# Altium schematic sheet Transceptor LIN.SchDoc
size A; SheetNumber: 5; SheetTotal: 7
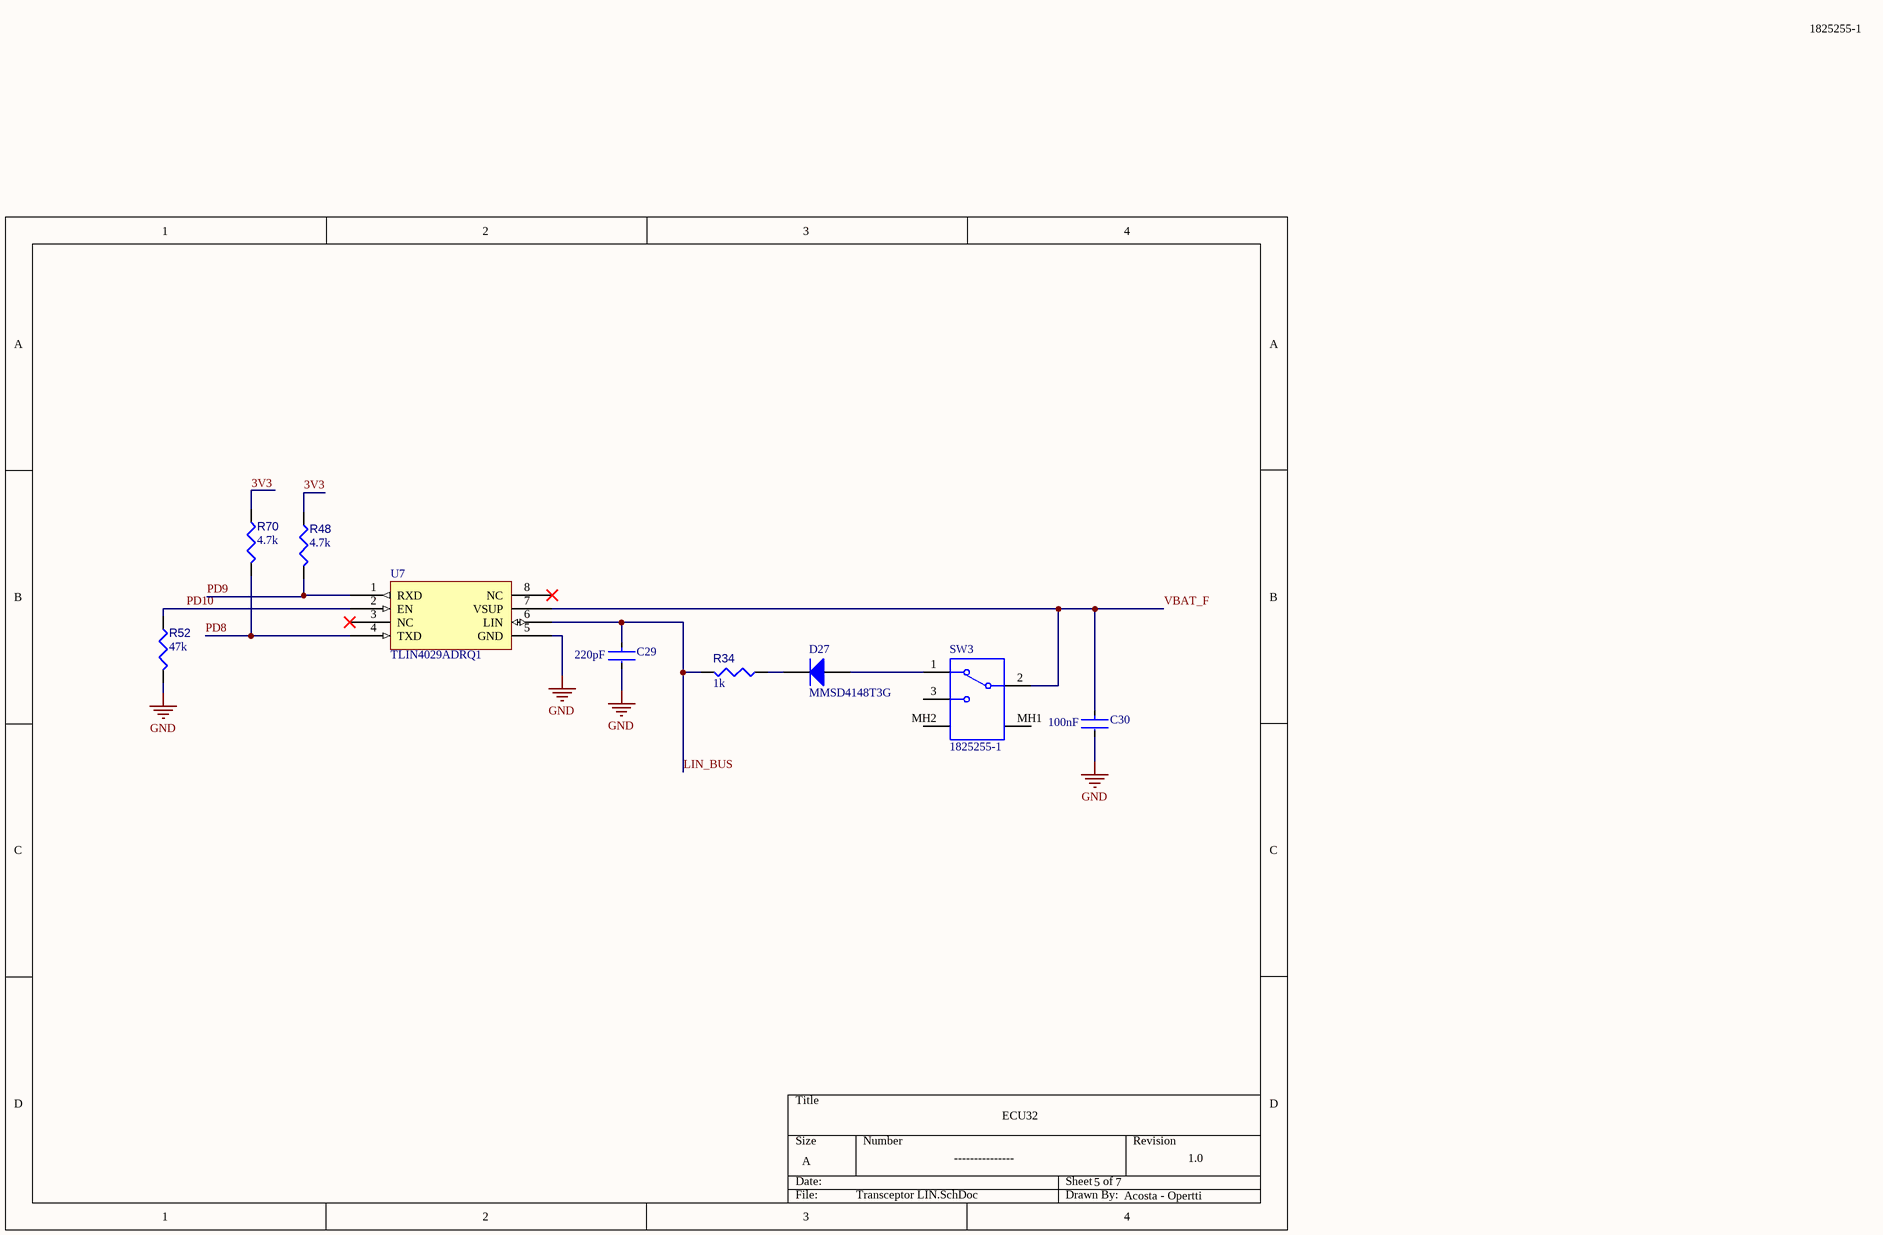
[diagram p0: Transceptor LIN.SchDoc]

## Parts
C29  Capacitance: 220pF  [FP-RCE0DB-MFG]  (hidden comment: C322C221K5R5TA)
C30  Capacitance: 100nF  [FP-RCE0DB-MFG]  (hidden comment: RCE5C1H100J0A2H03B)
D27  MMSD4148T3G  [ONSC-SOD-123-2-425-04_V]
R34  value 1k  [RESA60-630X240]  (hidden comment: MFR-25FBF52-47R5)
R48  value 4.7k  [RESA60-630X240]  (hidden comment: MFR-25FBF52-47R5)
R52  value 47k  [RESA60-630X240]  (hidden comment: MFR-25FBF52-47R5)
R70  value 4.7k  [RESA60-630X240]  (hidden comment: MFR-25FBF52-47R5)
SW3  1825255-1  [TECO-1825255-1_V]
U7  TLIN4029ADRQ1  [SOIC127P600X175-8M]

## Nets
GND: C29.2 C30.2 R52.2 U7.5(GND)
3V3: R48.1 R70.1
LIN_BUS: C29.1 R34.2 U7.6(LIN)
PD8: R70.2 U7.4(TXD)
PD9: R48.2 U7.1(RXD)
PD10: R52.1 U7.2(EN)
VBAT_F: C30.1 SW3.2 U7.7(VSUP)
NetD27_1: D27.1(K) R34.1
NetD27_2: D27.2(A) SW3.1

Not connected (* = marked no-connect by the designer): SW3 3 MH1 MH2; U7 3(NC)* 8(NC)*

## Notes on the sheet
- 1825255-1
- ECU32
- ---------------
- 5
- 7
- 1.0
- Acosta - Opertti

## Library data of the parts
C29 C30 = CMP-06035-046743-1: Cap Ceramic 10pF 50V C0G ±5% Radial 2.5mm +125°C Bulk; Lead Diameter: 0.5mm; Lead/Base Style: Straight; Width: 2.5mm; Voltage Rating: 50V; Max Operating Temperature: 125°C; Length: 0.142inch; Lead Pitch: 0.098inch; Min Operating Temperature: -55°C; Termination: Radial; Tolerance: 5%; Dielectric: C0G; Packaging: Bulk; Package Quantity: 500; Voltage Rating (DC): 50V; Case/Package: Radial; Ratings: AEC-Q200; Lead Free: Lead Free; Height: 3.5mm; Resistor Type: Ceramic; Height - Seated (Max): 0.138inch; Mount: Through Hole
D27 = CMP-0895-00002-2: Switching Diode, 2-Pin SOD-123, Pb-Free, Tape and Reel; Manufacturer: On Semiconductor; Configuration: Single; trr Max (ns): 4; IF Max (A): 0.2; ComponentLink1Description: Manufacturer URL; PackageReference: SOD-123-2-425-04; ComponentLink2Description: Datasheet; PackageVersion: Rev. G, 10/2009; PartNumber: MMSD4148T3G; ComponentLink3Description: Package Specification; ComponentLink1URL: http://www.onsemi.com/; PackageDescription: 2-Pin SOD, Body 1.6 x 2.69 mm; DatasheetVersion: Rev. 11; Packing: Tape and Reel; RoHS: TRUE; ComponentLink2URL: http://www.onsemi.com/pub_link/Collateral/MMSD4148T1-D.PDF; Mounting Technology: Surface Mount; ComponentLink3URL: http://www.onsemi.com/pub_link/Collateral/425-04.PDF
R34 R48 R52 R70 = CMP-009-00058-4: Axial Resistor, 47.5 Ohm, +/- 1%, 0.25 W, -55 to 155 degC, 2-Pin THD, RoHS, Bulk; Manufacturer: Yageo; Voltage Rating: 250V; Power: 250mW; Packaging: Bulk; Package Description: 2-Pin Axial Lead, Dia 2.4 mm, Body Length 6.3 mm; Package Reference: MFR-25; Case/Package: Axial; Tolerance: 1%; RoHS Compliant: True; Package Quantity: 200; Max Operating Temperature: 155°C; Manufacturer URL: http://www.yageo.com/; Datasheet URL: http://www.yageo.com/documents/recent/Yageo%20LR_MFR_2013.pdf; Min Operating Temperature: -55°C; Datasheet Version: Apr-13; Mounting Technology: TH
SW3 = CMP-011-00001-2: Slide Switch, SPDT, 0.3A, 125 V, -20 to 85 degC, 5-Pin THD, RoHS, Tray; Manufacturer: TE Connectivity; Current Rating: 300mA; Voltage Rating (AC): 125V; Max Contact Resistance: 30mohm; Operating Force: 600gf; Manufacturer URL: http://www.te.com/; Max Current Rating: 300mA; Contact Plating: Silver; Contact Material: Copper; Datasheet URL: http://www.te.com/commerce/DocumentDelivery/DDEController?Action=showdoc&DocId=Customer+Drawing%7F1825255%7FA4%7Fpdf%7FEnglish%7FENG_CD_1825255_A4_baseFilename.pdf%7F1825255-1; Throw Configuration: SPDT; Packaging: Bulk; Package Quantity: 560; Max Voltage Rating (AC): 125V; Mounting Technology: TH; RoHS Compliant: True; Case/Package: 1825255-1; Datasheet Version: Rev. A4, 03/2014; Contact Finish: Silver; Package Reference: 1825255-1; Package Description: 5-Pin Through Hole Device, Body 6.7 x 16 mm, Pitch 4 mm; Min Operating Temperature: -20°C; Max Operating Temperature: 85°C
U7 = CMP-015-00010-1: Local interconnect network (LIN) transceiver with dominant state timeout and ±70V fault protection 8-SOIC -40 to 125; Case/Package: SOIC; Pins: 8